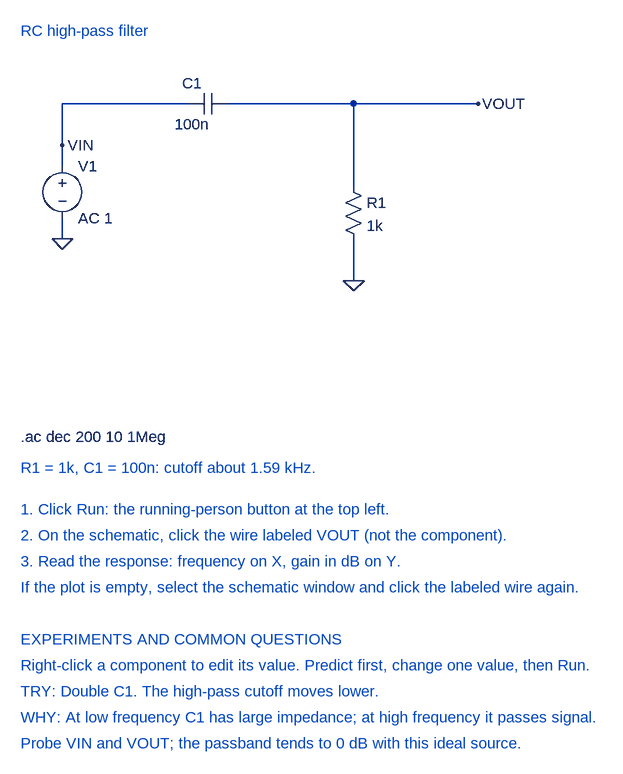
[diagram p0: schematic 09-rc-high-pass.asc]
09-rc-high-pass.asc, the LTspice schematic file:
Version 4
SHEET 1 1200 1400
WIRE 128 208 128 240
WIRE 128 320 128 352
WIRE 128 208 128 144
WIRE 128 144 320 144
WIRE 384 144 768 144
WIRE 576 144 576 272
WIRE 576 352 576 416
FLAG 128 208 VIN
FLAG 128 352 0
FLAG 576 416 0
FLAG 768 144 VOUT
SYMBOL voltage 128 224 R0
SYMATTR InstName V1
SYMATTR Value AC 1
SYMBOL cap 384 128 R90
WINDOW 0 0 56 VBottom 2
WINDOW 3 32 56 VTop 2
SYMATTR InstName C1
SYMATTR Value 100n
SYMBOL res 560 256 R0
SYMATTR InstName R1
SYMATTR Value 1k
TEXT 64 32 Left 2 ;RC high-pass filter
TEXT 64 656 Left 2 !.ac dec 200 10 1Meg
TEXT 64 704 Left 2 ;R1 = 1k, C1 = 100n: cutoff about 1.59 kHz.
TEXT 64 768 Left 2 ;1. Click Run: the running-person button at the top left.
TEXT 64 808 Left 2 ;2. On the schematic, click the wire labeled VOUT (not the component).
TEXT 64 848 Left 2 ;3. Read the response: frequency on X, gain in dB on Y.
TEXT 64 888 Left 2 ;If the plot is empty, select the schematic window and click the labeled wire again.
TEXT 64 968 Left 2 ;EXPERIMENTS AND COMMON QUESTIONS
TEXT 64 1008 Left 2 ;Right-click a component to edit its value. Predict first, change one value, then Run.
TEXT 64 1048 Left 2 ;TRY: Double C1. The high-pass cutoff moves lower.
TEXT 64 1088 Left 2 ;WHY: At low frequency C1 has large impedance; at high frequency it passes signal.
TEXT 64 1128 Left 2 ;Probe VIN and VOUT; the passband tends to 0 dB with this ideal source.

The netlist it stands for:
* 09-rc-high-pass.asc
V1 VIN 0 AC 1
C1 VOUT VIN 100n
R1 VOUT 0 1k
* RC high-pass filter
.ac dec 200 10 1Meg
* R1 = 1k, C1 = 100n: cutoff about 1.59 kHz.
* 1. Click Run: the running-person button at the top left.
* 2. On the schematic, click the wire labeled VOUT (not the component).
* 3. Read the response: frequency on X, gain in dB on Y.
* If the plot is empty, select the schematic window and click the labeled wire again.
* EXPERIMENTS AND COMMON QUESTIONS
* Right-click a component to edit its value. Predict first, change one value, then Run.
* TRY: Double C1. The high-pass cutoff moves lower.
* WHY: At low frequency C1 has large impedance; at high frequency it passes signal.
* Probe VIN and VOUT; the passband tends to 0 dB with this ideal source.
.backanno
.end